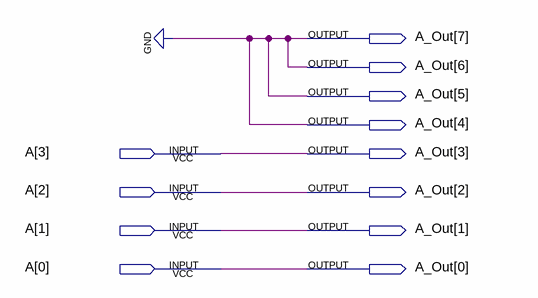
[diagram p0: schematic sheet]
// Quartus schematic InA.bdf as structural Verilog: 0 symbols, 12 pins
module InA (
  input  [3:0] A,
  output [7:0] A_Out
);


  assign A_Out = {4'b0000, A};
endmodule
